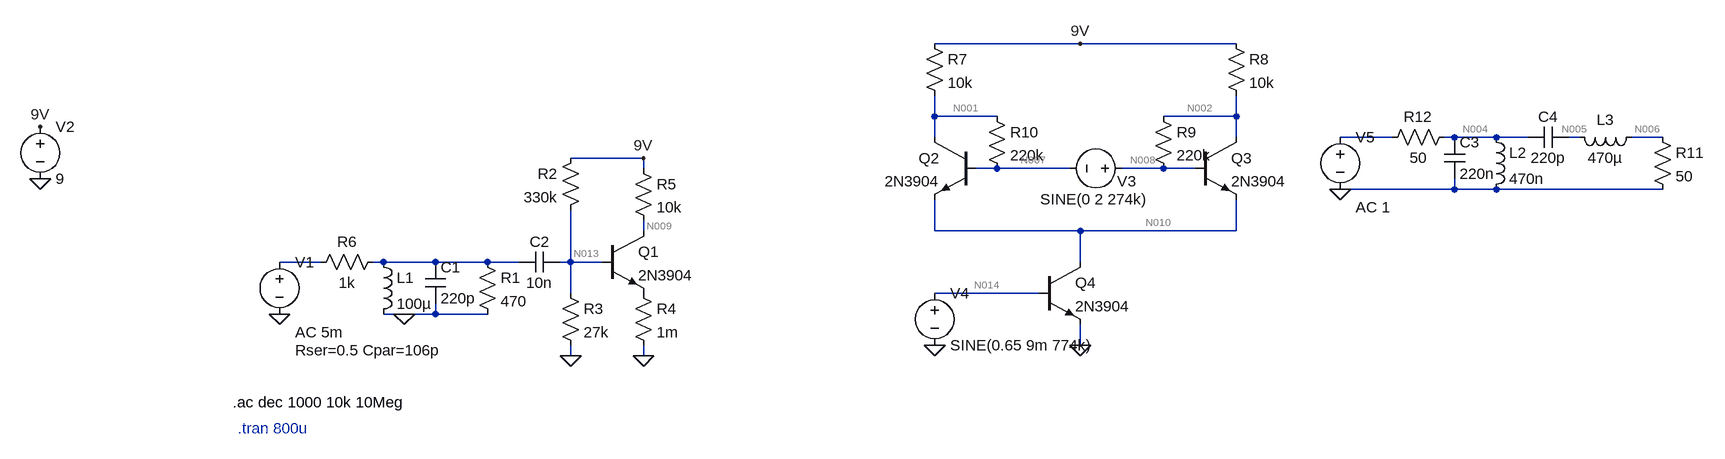
[diagram p0: schematic AM Radio.asc]
AM Radio.asc, the LTspice schematic file:
Version 4
SHEET 1 2196 680
WIRE 1232 -176 1008 -176
WIRE 1472 -176 1232 -176
WIRE 1008 -64 1008 -96
WIRE 1104 -64 1008 -64
WIRE 1472 -64 1472 -96
WIRE 1472 -64 1360 -64
WIRE 1008 -32 1008 -64
WIRE 1472 -32 1472 -64
WIRE 1712 -32 1632 -32
WIRE 1808 -32 1792 -32
WIRE 1872 -32 1808 -32
WIRE 1920 -32 1872 -32
WIRE 2000 -32 1984 -32
WIRE 2128 -32 2080 -32
WIRE 560 0 448 0
WIRE 560 16 560 0
WIRE 1104 16 1072 16
WIRE 1216 16 1104 16
WIRE 1360 16 1296 16
WIRE 1408 16 1360 16
WIRE 1808 48 1808 32
WIRE 1808 48 1632 48
WIRE 1872 48 1808 48
WIRE 2128 48 1872 48
WIRE 560 112 560 96
WIRE 1008 112 1008 64
WIRE 1232 112 1008 112
WIRE 1472 112 1472 64
WIRE 1472 112 1232 112
WIRE 64 160 0 160
WIRE 160 160 144 160
WIRE 240 160 160 160
WIRE 320 160 240 160
WIRE 368 160 320 160
WIRE 448 160 448 80
WIRE 448 160 432 160
WIRE 496 160 448 160
WIRE 1232 160 1232 112
WIRE 448 208 448 160
WIRE 1168 208 1008 208
WIRE 192 240 160 240
WIRE 240 240 240 224
WIRE 240 240 192 240
WIRE 320 240 240 240
WIRE 1232 288 1232 256
WIRE 448 304 448 288
WIRE 560 304 560 288
FLAG 0 240 0
FLAG 192 240 0
FLAG -368 32 0
FLAG -368 -48 9V
FLAG 560 0 9V
FLAG 448 304 0
FLAG 560 304 0
FLAG 1232 288 0
FLAG 1232 -176 9V
FLAG 1008 288 0
FLAG 1632 48 0
SYMBOL voltage 0 144 R0
WINDOW 123 24 124 Left 2
WINDOW 39 24 152 Left 2
SYMATTR InstName V1
SYMATTR Value ""
SYMATTR Value2 AC 5m
SYMATTR SpiceLine Rser=0.5 Cpar=106p
SYMBOL ind 144 144 R0
SYMATTR InstName L1
SYMATTR Value 100µ
SYMBOL cap 224 160 R0
SYMATTR InstName C1
SYMATTR Value 220p
SYMBOL voltage -368 -64 R0
WINDOW 123 0 0 Left 0
WINDOW 39 0 0 Left 0
SYMATTR InstName V2
SYMATTR Value 9
SYMBOL npn 496 112 R0
SYMATTR InstName Q1
SYMATTR Value 2N3904
SYMBOL res 464 -16 M0
SYMATTR InstName R2
SYMATTR Value 330k
SYMBOL res 432 192 R0
SYMATTR InstName R3
SYMATTR Value 27k
SYMBOL res 544 0 R0
SYMATTR InstName R5
SYMATTR Value 10k
SYMBOL cap 432 144 R90
WINDOW 0 0 32 VBottom 2
WINDOW 3 32 32 VTop 2
SYMATTR InstName C2
SYMATTR Value 10n
SYMBOL res 544 192 R0
SYMATTR InstName R4
SYMATTR Value 1m
SYMBOL res 304 144 R0
SYMATTR InstName R1
SYMATTR Value 470
SYMBOL res 160 144 R90
WINDOW 0 0 56 VBottom 2
WINDOW 3 32 56 VTop 2
SYMATTR InstName R6
SYMATTR Value 1k
SYMBOL voltage 1312 16 M270
WINDOW 0 -20 23 VLeft 2
WINDOW 3 -47 142 VLeft 2
WINDOW 123 0 0 Left 0
WINDOW 39 0 0 Left 0
SYMATTR InstName V3
SYMATTR Value SINE(0 2 274k)
SYMBOL voltage 1008 192 R0
WINDOW 123 0 0 Left 0
WINDOW 39 0 0 Left 0
SYMATTR InstName V4
SYMATTR Value SINE(0.65 9m 774k)
SYMBOL npn 1072 -32 M0
SYMATTR InstName Q2
SYMATTR Value 2N3904
SYMBOL npn 1408 -32 R0
SYMATTR InstName Q3
SYMATTR Value 2N3904
SYMBOL npn 1168 160 R0
SYMATTR InstName Q4
SYMATTR Value 2N3904
SYMBOL res 992 -192 R0
SYMATTR InstName R7
SYMATTR Value 10k
SYMBOL res 1456 -192 R0
SYMATTR InstName R8
SYMATTR Value 10k
SYMBOL res 1344 -80 R0
SYMATTR InstName R9
SYMATTR Value 220k
SYMBOL res 1088 -80 R0
SYMATTR InstName R10
SYMATTR Value 220k
SYMBOL cap 1792 -32 R0
SYMATTR InstName C3
SYMATTR Value 220n
SYMBOL ind 1856 -48 R0
SYMATTR InstName L2
SYMATTR Value 470n
SYMBOL cap 1984 -48 R90
WINDOW 0 0 32 VBottom 2
WINDOW 3 32 32 VTop 2
SYMATTR InstName C4
SYMATTR Value 220p
SYMBOL ind 2096 -48 R90
WINDOW 0 5 56 VBottom 2
WINDOW 3 32 56 VTop 2
SYMATTR InstName L3
SYMATTR Value 470µ
SYMBOL res 2112 -48 R0
SYMATTR InstName R11
SYMATTR Value 50
SYMBOL res 1808 -48 R90
WINDOW 0 0 56 VBottom 2
WINDOW 3 32 56 VTop 2
SYMATTR InstName R12
SYMATTR Value 50
SYMBOL voltage 1632 -48 R0
WINDOW 123 24 124 Left 2
WINDOW 39 0 0 Left 0
SYMATTR InstName V5
SYMATTR Value ""
SYMATTR Value2 AC 1
TEXT -72 376 Left 2 !.ac dec 1000 10k 10Meg
TEXT -64 416 Left 2 ;.tran 800u

The netlist it stands for:
* AM Radio.asc
V1 N011 0 AC 5m Rser=0.5 Cpar=106p
L1 N012 0 100µ
C1 N012 0 220p
V2 9V 0 9
Q1 N009 N013 P001 0 2N3904
R2 9V N013 330k
R3 N013 0 27k
R5 9V N009 10k
C2 N013 N012 10n
R4 P001 0 1m
R1 N012 0 470
R6 N012 N011 1k
V3 N008 N007 SINE(0 2 274k)
V4 N014 0 SINE(0.65 9m 774k)
Q2 N001 N007 N010 0 2N3904
Q3 N002 N008 N010 0 2N3904
Q4 N010 N014 0 0 2N3904
R7 9V N001 10k
R8 9V N002 10k
R9 N002 N008 220k
R10 N001 N007 220k
C3 N004 0 220n
L2 N004 0 470n
C4 N005 N004 220p
L3 N006 N005 470µ
R11 N006 0 50
R12 N004 N003 50
V5 N003 0 AC 1
.model NPN NPN
.model PNP PNP
.lib standard.bjt
.ac dec 1000 10k 10Meg
* .tran 800u
.backanno
.end

* Results of the author's LTspice run, read from the files saved beside the schematic
* Operating Point, zero values left out:
*   V(9v) = 9 V
*   V(n009) = 3.715 V
*   V(n013) = 638 mV
*   V(p001) = 530.2 nV
*   V(n008) = 4.491 V
*   V(n007) = 4.491 V
*   V(n014) = 650 mV
*   V(n001) = 4.797 V
*   V(n010) = 3.858 V
*   V(n002) = 4.797 V
*   Ic(Q1) = 528.5 µA
*   Ib(Q1) = 1.711 µA
*   Ie(Q1) = -530.2 µA
*   Ic(Q2) = 418.9 µA
*   Ib(Q2) = 1.393 µA
*   Ie(Q2) = -420.3 µA
*   Ic(Q3) = 418.9 µA
*   Ib(Q3) = 1.393 µA
*   Ie(Q3) = -420.3 µA
*   Ic(Q4) = 840.5 µA
*   Ib(Q4) = 2.72 µA
*   Ie(Q4) = -843.2 µA
*   I(R2) = 25.34 µA
*   I(R3) = 23.63 µA
*   I(R5) = 528.5 µA
*   I(R4) = 530.2 µA
*   I(R7) = 420.3 µA
*   I(R8) = 420.3 µA
*   I(R9) = 1.393 µA
*   I(R10) = 1.393 µA
*   I(V2) = -1.394 mA
*   I(V4) = -2.72 µA
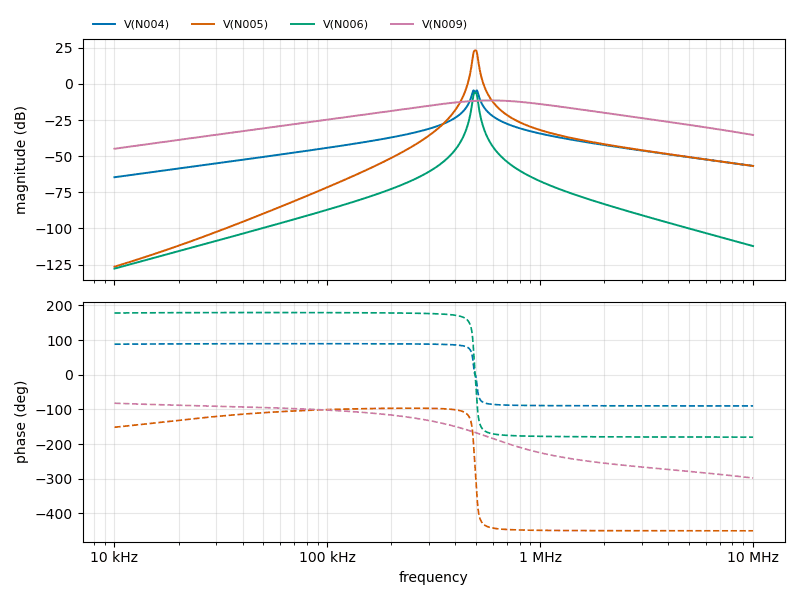
[diagram p1: AC Analysis of AM Radio.asc, plotted from the saved traces]
* AC Analysis, 1 run:
*   V(N004): -64.57 dB at 10 kHz, -56.77 dB at 10 MHz, peak -4.42 dB at 503.5 kHz, 3 dB below the peak at 477.8 kHz and 512.7 kHz
*   V(N005): -126.47 dB at 10 kHz, -56.75 dB at 10 MHz, peak 23.23 dB at 496.6 kHz, 3 dB below the peak at 484.3 kHz and 506.3 kHz
*   V(N006): -127.77 dB at 10 kHz, -112.17 dB at 10 MHz, peak -6.12 dB at 495.5 kHz, 3 dB below the peak at 484 kHz and 506.1 kHz
*   V(N009): -44.84 dB at 10 kHz, -35.29 dB at 10 MHz, peak -11.41 dB at 586.1 kHz, 3 dB below the peak at 323 kHz and 1.063 MHz